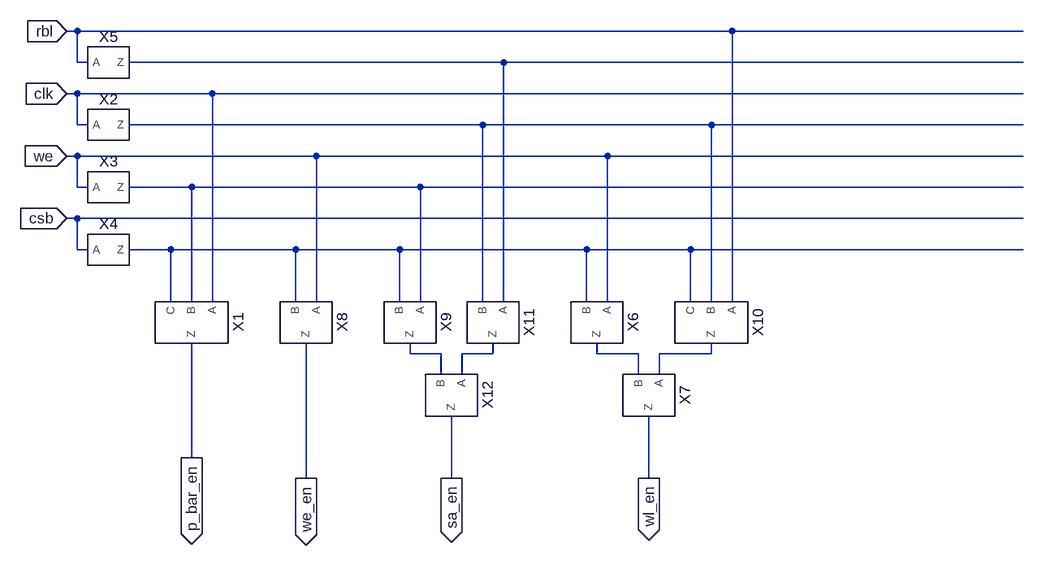
[diagram p0: schematic logic_control.asc]
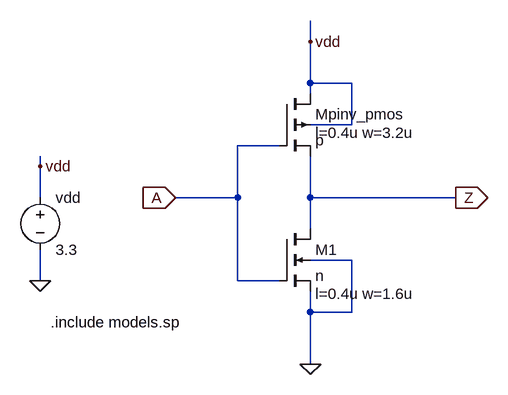
[diagram p1: sub-circuit inv.asc]
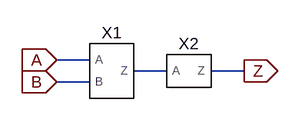
[diagram p2: sub-circuit and2.asc]
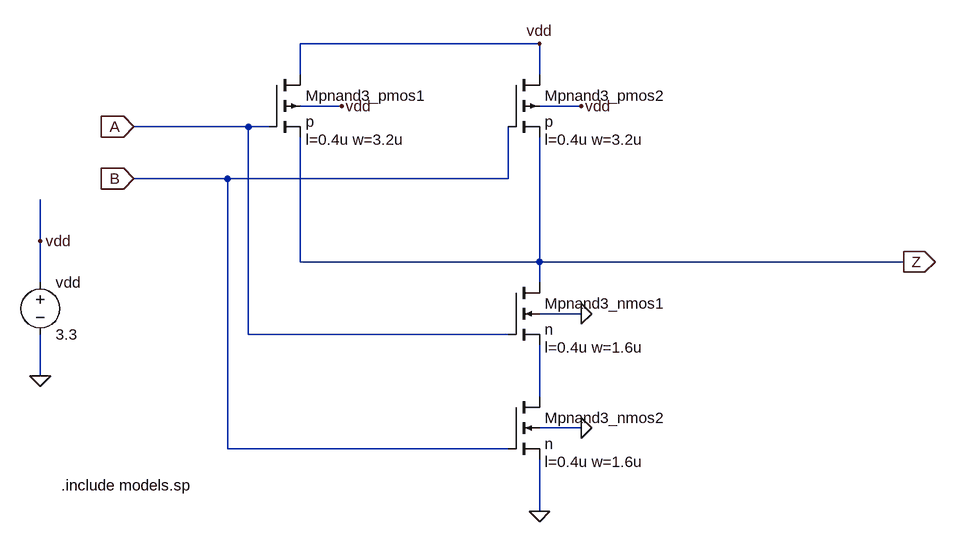
[diagram p3: sub-circuit nand2.asc]
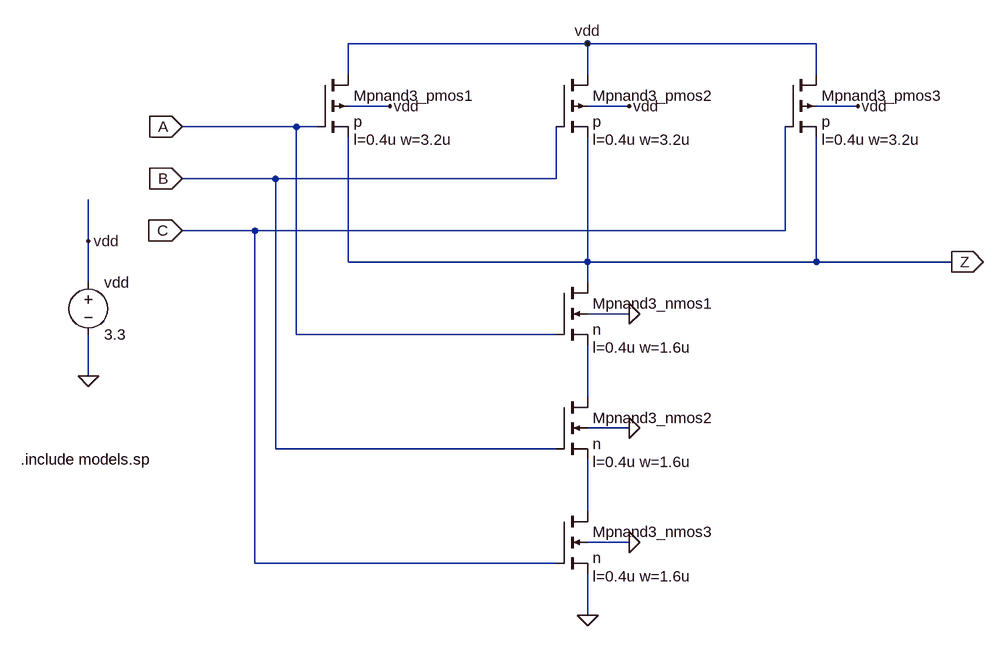
[diagram p4: sub-circuit nand3.asc]
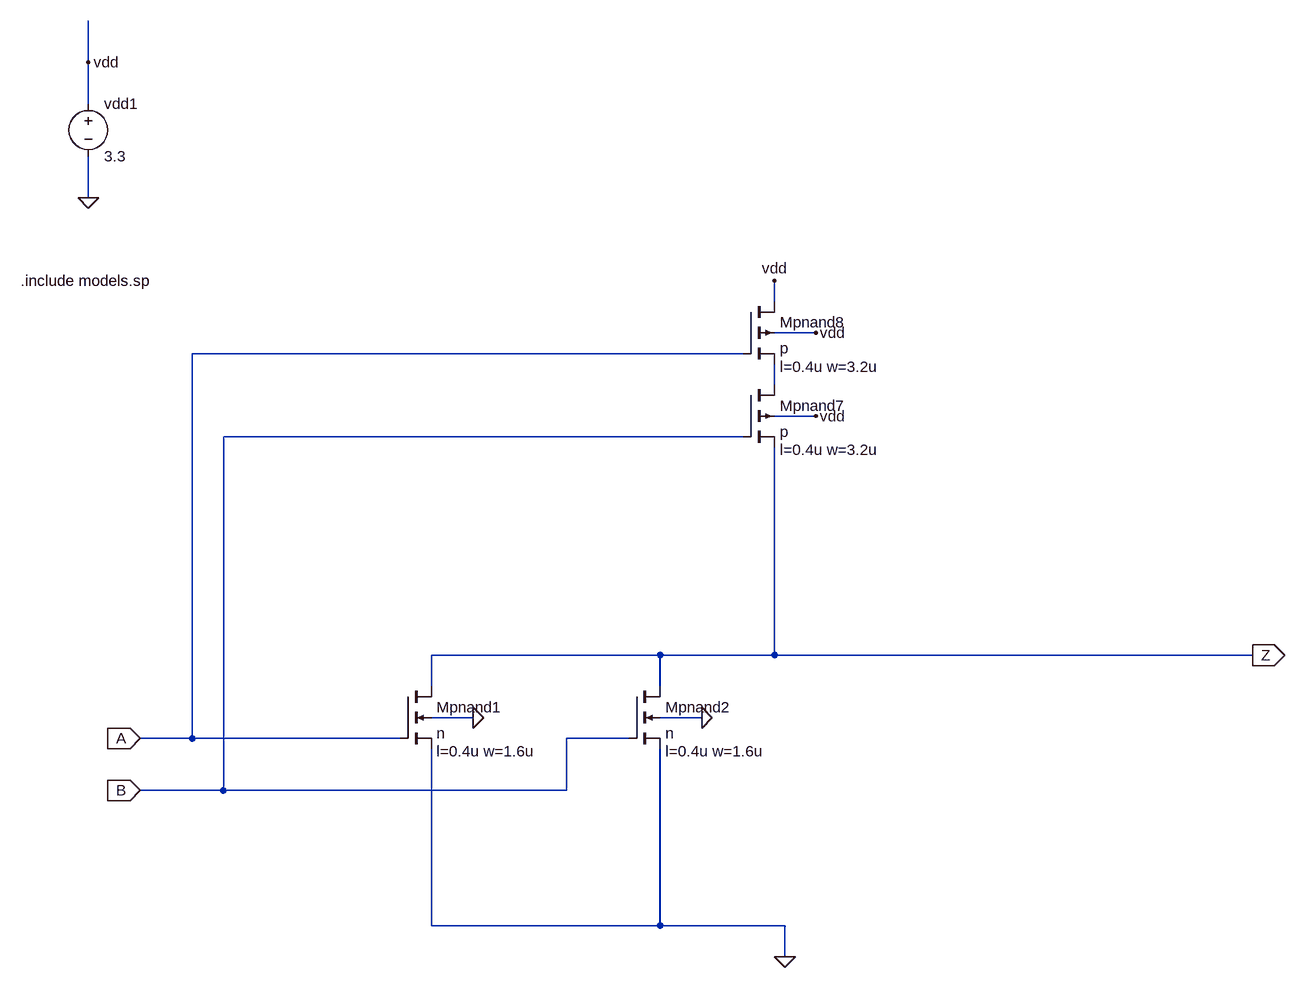
[diagram p5: sub-circuit nor2.asc]
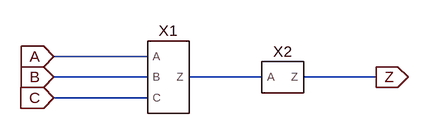
[diagram p6: sub-circuit and3.asc]
logic_control.asc, the LTspice schematic file:
Version 4
SHEET 1 1940 864
WIRE 0 -16 -16 -16
WIRE 1008 -16 0 -16
WIRE 1456 -16 1008 -16
WIRE 0 32 0 -16
WIRE 16 32 0 32
WIRE 656 32 80 32
WIRE 1456 32 656 32
WIRE 0 80 -16 80
WIRE 208 80 0 80
WIRE 1456 80 208 80
WIRE 0 128 0 80
WIRE 16 128 0 128
WIRE 624 128 80 128
WIRE 976 128 624 128
WIRE 1456 128 976 128
WIRE 0 176 -16 176
WIRE 368 176 0 176
WIRE 816 176 368 176
WIRE 1456 176 816 176
WIRE 0 224 0 176
WIRE 16 224 0 224
WIRE 176 224 80 224
WIRE 528 224 176 224
WIRE 1456 224 528 224
WIRE 0 272 -16 272
WIRE 1456 272 0 272
WIRE 0 320 0 272
WIRE 16 320 0 320
WIRE 144 320 80 320
WIRE 336 320 144 320
WIRE 496 320 336 320
WIRE 784 320 496 320
WIRE 944 320 784 320
WIRE 1456 320 944 320
WIRE 144 400 144 320
WIRE 176 400 176 224
WIRE 208 400 208 80
WIRE 336 400 336 320
WIRE 368 400 368 176
WIRE 496 400 496 320
WIRE 528 400 528 224
WIRE 624 400 624 128
WIRE 656 400 656 32
WIRE 784 400 784 320
WIRE 816 400 816 176
WIRE 944 400 944 320
WIRE 976 400 976 128
WIRE 1008 400 1008 -16
WIRE 512 480 512 464
WIRE 560 480 512 480
WIRE 640 480 640 464
WIRE 640 480 592 480
WIRE 800 480 800 464
WIRE 864 480 800 480
WIRE 976 480 976 464
WIRE 976 480 896 480
WIRE 560 512 560 480
WIRE 592 512 592 480
WIRE 864 512 864 480
WIRE 896 512 896 480
WIRE 176 640 176 464
WIRE 352 672 352 464
WIRE 576 672 576 576
WIRE 880 672 880 576
FLAG 352 672 we_en
IOPIN 352 672 Out
FLAG 176 640 p_bar_en
IOPIN 176 640 Out
FLAG 576 672 sa_en
IOPIN 576 672 Out
FLAG -16 80 clk
IOPIN -16 80 In
FLAG -16 176 we
IOPIN -16 176 In
FLAG -16 272 csb
IOPIN -16 272 In
FLAG -16 -16 rbl
IOPIN -16 -16 In
FLAG 880 672 wl_en
IOPIN 880 672 Out
SYMBOL inv 48 128 R0
SYMATTR InstName X2
SYMBOL inv 48 224 R0
SYMATTR InstName X3
SYMBOL inv 48 320 R0
SYMATTR InstName X4
SYMBOL and2 352 432 R90
SYMATTR InstName X8
SYMBOL nand3 176 432 R90
SYMATTR InstName X1
SYMBOL inv 48 32 R0
SYMATTR InstName X5
SYMBOL and2 512 432 R90
SYMATTR InstName X9
SYMBOL and2 640 432 R90
SYMATTR InstName X11
SYMBOL and2 576 544 R90
SYMATTR InstName X12
SYMBOL and2 800 432 R90
SYMATTR InstName X6
SYMBOL nor2 880 544 R90
SYMATTR InstName X7
SYMBOL and3 976 432 R90
SYMATTR InstName X10

inv.asc, the sub-circuit schematic file:
Version 4
SHEET 1 880 680
WIRE 112 -128 112 -160
WIRE 112 -64 112 -128
WIRE 176 -64 112 -64
WIRE 112 -48 112 -64
WIRE 176 0 176 -64
WIRE 176 0 112 0
WIRE 64 32 0 32
WIRE -304 64 -304 48
WIRE -304 112 -304 64
WIRE 0 112 0 32
WIRE 0 112 -96 112
WIRE 112 112 112 48
WIRE 336 112 112 112
WIRE 112 160 112 112
WIRE 176 208 112 208
WIRE -304 240 -304 192
WIRE 0 240 0 112
WIRE 64 240 0 240
WIRE 112 288 112 256
WIRE 176 288 176 208
WIRE 176 288 112 288
WIRE 112 368 112 288
FLAG -96 112 A
IOPIN -96 112 In
FLAG 336 112 Z
IOPIN 336 112 Out
FLAG 112 368 0
FLAG -304 240 0
FLAG 112 -128 vdd
FLAG -304 64 vdd
SYMBOL nmos4 64 160 R0
WINDOW 123 56 100 Left 2
SYMATTR Value2 l=0.4u w=1.6u
SYMATTR InstName M1
SYMATTR Value n
SYMBOL pmos4 64 -48 R0
WINDOW 123 56 60 Left 2
SYMATTR Value2 l=0.4u w=3.2u
SYMATTR InstName Mpinv_pmos
SYMATTR Value p
SYMBOL voltage -304 96 R0
SYMATTR InstName vdd
SYMATTR Value 3.3
TEXT -288 304 Left 2 !.include models.sp

and2.asc, the sub-circuit schematic file:
Version 4
SHEET 1 880 680
WIRE 48 96 0 96
WIRE 160 112 112 112
WIRE 272 112 224 112
WIRE 48 128 0 128
FLAG 0 96 A
IOPIN 0 96 In
FLAG 0 128 B
IOPIN 0 128 In
FLAG 272 112 Z
IOPIN 272 112 Out
SYMBOL inv 192 112 R0
SYMATTR InstName X2
SYMBOL nand2 80 112 R0
SYMATTR InstName X1

nand2.asc, the sub-circuit schematic file:
Version 4
SHEET 1 1192 1028
WIRE 560 128 192 128
WIRE 192 176 192 128
WIRE 560 176 560 128
WIRE 256 224 192 224
WIRE 624 224 560 224
WIRE 112 256 -64 256
WIRE 144 256 112 256
WIRE 80 336 -64 336
WIRE 512 336 512 256
WIRE 512 336 80 336
WIRE -208 432 -208 368
WIRE 192 464 192 272
WIRE 560 464 560 272
WIRE 560 464 192 464
WIRE 1120 464 560 464
WIRE -208 496 -208 432
WIRE 560 496 560 464
WIRE 624 544 560 544
WIRE 112 576 112 256
WIRE 512 576 112 576
WIRE -208 640 -208 576
WIRE 560 672 560 592
WIRE 624 720 560 720
WIRE 80 752 80 336
WIRE 512 752 80 752
WIRE 560 848 560 768
FLAG -64 256 A
IOPIN -64 256 In
FLAG -64 336 B
IOPIN -64 336 In
FLAG 1120 464 Z
IOPIN 1120 464 Out
FLAG -208 640 0
FLAG 624 544 0
FLAG 624 720 0
FLAG -208 432 vdd
FLAG 256 224 vdd
FLAG 624 224 vdd
FLAG 560 848 0
FLAG 560 128 vdd
SYMBOL pmos4 144 176 R0
WINDOW 123 56 100 Left 2
SYMATTR Value2 l=0.4u w=3.2u
SYMATTR InstName Mpnand3_pmos1
SYMATTR Value p
SYMBOL pmos4 512 176 R0
WINDOW 123 56 100 Left 2
SYMATTR Value2 l=0.4u w=3.2u
SYMATTR InstName Mpnand3_pmos2
SYMATTR Value p
SYMBOL nmos4 512 496 R0
WINDOW 123 56 100 Left 2
SYMATTR Value2 l=0.4u w=1.6u
SYMATTR InstName Mpnand3_nmos1
SYMATTR Value n
SYMBOL nmos4 512 672 R0
WINDOW 123 56 100 Left 2
SYMATTR Value2 l=0.4u w=1.6u
SYMATTR InstName Mpnand3_nmos2
SYMATTR Value n
SYMBOL voltage -208 480 R0
WINDOW 123 0 0 Left 0
WINDOW 39 0 0 Left 0
SYMATTR InstName vdd
SYMATTR Value 3.3
TEXT -176 808 Left 2 !.include models.sp

nand3.asc, the sub-circuit schematic file:
Version 4
SHEET 1 1192 1028
WIRE 560 128 192 128
WIRE 912 128 560 128
WIRE 192 176 192 128
WIRE 560 176 560 128
WIRE 912 176 912 128
WIRE 256 224 192 224
WIRE 624 224 560 224
WIRE 976 224 912 224
WIRE 112 256 -64 256
WIRE 144 256 112 256
WIRE 80 336 -64 336
WIRE 512 336 512 256
WIRE 512 336 80 336
WIRE 48 416 -64 416
WIRE 864 416 864 256
WIRE 864 416 48 416
WIRE -208 432 -208 368
WIRE 192 464 192 272
WIRE 560 464 560 272
WIRE 560 464 192 464
WIRE 912 464 912 272
WIRE 912 464 560 464
WIRE 1120 464 912 464
WIRE -208 496 -208 432
WIRE 560 496 560 464
WIRE 624 544 560 544
WIRE 112 576 112 256
WIRE 512 576 112 576
WIRE -208 640 -208 576
WIRE 560 672 560 592
WIRE 624 720 560 720
WIRE 80 752 80 336
WIRE 512 752 80 752
WIRE 560 848 560 768
WIRE 624 896 560 896
WIRE 48 928 48 416
WIRE 512 928 48 928
WIRE 560 1008 560 944
FLAG -64 256 A
IOPIN -64 256 In
FLAG -64 336 B
IOPIN -64 336 In
FLAG -64 416 C
IOPIN -64 416 In
FLAG 1120 464 Z
IOPIN 1120 464 Out
FLAG -208 640 0
FLAG 624 544 0
FLAG 624 720 0
FLAG 624 896 0
FLAG -208 432 vdd
FLAG 256 224 vdd
FLAG 624 224 vdd
FLAG 976 224 vdd
FLAG 560 1008 0
FLAG 560 128 vdd
SYMBOL pmos4 144 176 R0
WINDOW 123 56 100 Left 2
SYMATTR Value2 l=0.4u w=3.2u
SYMATTR InstName Mpnand3_pmos1
SYMATTR Value p
SYMBOL pmos4 512 176 R0
WINDOW 123 56 100 Left 2
SYMATTR Value2 l=0.4u w=3.2u
SYMATTR InstName Mpnand3_pmos2
SYMATTR Value p
SYMBOL pmos4 864 176 R0
WINDOW 123 56 100 Left 2
SYMATTR Value2 l=0.4u w=3.2u
SYMATTR InstName Mpnand3_pmos3
SYMATTR Value p
SYMBOL nmos4 512 496 R0
WINDOW 123 56 100 Left 2
SYMATTR Value2 l=0.4u w=1.6u
SYMATTR InstName Mpnand3_nmos1
SYMATTR Value n
SYMBOL nmos4 512 672 R0
WINDOW 123 56 100 Left 2
SYMATTR Value2 l=0.4u w=1.6u
SYMATTR InstName Mpnand3_nmos2
SYMATTR Value n
SYMBOL nmos4 512 848 R0
WINDOW 123 56 100 Left 2
SYMATTR Value2 l=0.4u w=1.6u
SYMATTR InstName Mpnand3_nmos3
SYMATTR Value n
SYMBOL voltage -208 480 R0
WINDOW 123 0 0 Left 0
WINDOW 39 0 0 Left 0
SYMATTR InstName vdd
SYMATTR Value 3.3
TEXT -312 768 Left 2 !.include models.sp

nor2.asc, the sub-circuit schematic file:
Version 4
SHEET 1 1096 680
WIRE -768 -736 -768 -800
WIRE -768 -672 -768 -736
WIRE -768 -528 -768 -592
WIRE 288 -368 288 -400
WIRE 352 -320 288 -320
WIRE 240 -288 -608 -288
WIRE 288 -240 288 -272
WIRE 352 -192 288 -192
WIRE 240 -160 -560 -160
WIRE 112 176 -240 176
WIRE 288 176 288 -144
WIRE 288 176 112 176
WIRE 1024 176 288 176
WIRE -240 224 -240 176
WIRE 112 224 112 176
WIRE -176 272 -240 272
WIRE 176 272 112 272
WIRE -608 304 -608 -288
WIRE -608 304 -688 304
WIRE -288 304 -608 304
WIRE 64 304 -32 304
WIRE -560 384 -560 -160
WIRE -560 384 -688 384
WIRE -32 384 -32 304
WIRE -32 384 -560 384
WIRE -240 592 -240 320
WIRE 112 592 112 320
WIRE 112 592 -240 592
WIRE 304 592 112 592
WIRE 304 640 304 592
FLAG -688 304 A
IOPIN -688 304 In
FLAG -688 384 B
IOPIN -688 384 In
FLAG 1024 176 Z
IOPIN 1024 176 Out
FLAG -768 -528 0
FLAG -768 -736 vdd
FLAG -176 272 0
FLAG 176 272 0
FLAG 352 -192 vdd
FLAG 352 -320 vdd
FLAG 288 -400 vdd
FLAG 304 640 0
SYMBOL voltage -768 -688 R0
WINDOW 123 0 0 Left 0
WINDOW 39 0 0 Left 0
SYMATTR InstName vdd1
SYMATTR Value 3.3
SYMBOL nmos4 -288 224 R0
WINDOW 123 56 100 Left 2
SYMATTR Value2 l=0.4u w=1.6u
SYMATTR InstName Mpnand1
SYMATTR Value n
SYMBOL nmos4 64 224 R0
WINDOW 123 56 100 Left 2
SYMATTR Value2 l=0.4u w=1.6u
SYMATTR InstName Mpnand2
SYMATTR Value n
SYMBOL pmos4 240 -240 R0
WINDOW 123 56 100 Left 2
SYMATTR Value2 l=0.4u w=3.2u
SYMATTR InstName Mpnand7
SYMATTR Value p
SYMBOL pmos4 240 -368 R0
WINDOW 123 56 100 Left 2
SYMATTR Value2 l=0.4u w=3.2u
SYMATTR InstName Mpnand8
SYMATTR Value p
TEXT -872 -400 Left 2 !.include models.sp

and3.asc, the sub-circuit schematic file:
Version 4
SHEET 1 1192 1028
WIRE 256 304 112 304
WIRE 256 336 112 336
WIRE 432 336 320 336
WIRE 608 336 496 336
WIRE 256 368 112 368
FLAG 112 304 A
IOPIN 112 304 In
FLAG 112 336 B
IOPIN 112 336 In
FLAG 112 368 C
IOPIN 112 368 In
FLAG 608 336 Z
IOPIN 608 336 Out
SYMBOL nand3 288 336 R0
SYMATTR InstName X1
SYMBOL inv 464 336 R0
SYMATTR InstName X2

The netlist it stands for:
* logic_control.asc
XX2 clk N002 inv
XX3 we N003 inv
XX4 csb N004 inv
XX8 we N004 we_en and2
XX1 clk N003 N004 p_bar_en nand3
XX5 rbl N001 inv
XX9 N003 N004 N005 and2
XX11 N001 N002 N006 and2
XX12 N006 N005 sa_en and2
XX6 we N004 N007 and2
XX7 N008 N007 wl_en nor2
XX10 rbl N002 N004 N008 and3

* block symbol definitions
.subckt inv A Z
M1 Z A 0 0 n l=0.4u w=1.6u
Mpinv_pmos vdd A Z vdd p l=0.4u w=3.2u
vdd vdd 0 3.3
.include models.sp
.ends inv

.subckt and2 A B Z
XX2 N001 Z inv
XX1 A B N001 nand2
.ends and2

.subckt nand2 A B Z
Mpnand3_pmos1 vdd A Z vdd p l=0.4u w=3.2u
Mpnand3_pmos2 vdd B Z vdd p l=0.4u w=3.2u
Mpnand3_nmos1 Z A N001 0 n l=0.4u w=1.6u
Mpnand3_nmos2 N001 B 0 0 n l=0.4u w=1.6u
vdd vdd 0 3.3
.include models.sp
.ends nand2

.subckt nand3 A B C Z
Mpnand3_pmos1 vdd A Z vdd p l=0.4u w=3.2u
Mpnand3_pmos2 vdd B Z vdd p l=0.4u w=3.2u
Mpnand3_pmos3 vdd C Z vdd p l=0.4u w=3.2u
Mpnand3_nmos1 Z A N001 0 n l=0.4u w=1.6u
Mpnand3_nmos2 N001 B N002 0 n l=0.4u w=1.6u
Mpnand3_nmos3 N002 C 0 0 n l=0.4u w=1.6u
vdd vdd 0 3.3
.include models.sp
.ends nand3

.subckt nor2 A B Z
vdd1 vdd 0 3.3
Mpnand1 Z A 0 0 n l=0.4u w=1.6u
Mpnand2 Z B 0 0 n l=0.4u w=1.6u
Mpnand7 N001 B Z vdd p l=0.4u w=3.2u
Mpnand8 vdd A N001 vdd p l=0.4u w=3.2u
.include models.sp
.ends nor2

.subckt and3 A B C Z
XX1 A B C N001 nand3
XX2 N001 Z inv
.ends and3

.model NMOS NMOS
.model PMOS PMOS
.lib standard.mos
.backanno
.end